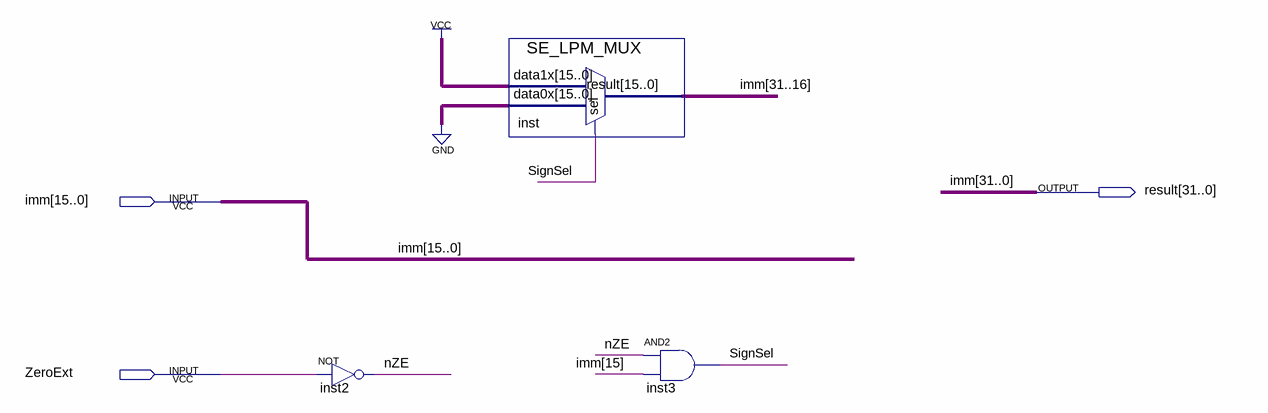
[diagram p0: schematic sheet]
// Quartus schematic SignExtender.bdf as structural Verilog: 3 symbols, 3 pins
module SignExtender (
  input  [15:0] imm,
  input  ZeroExt,
  output [31:0] result
);

  wire nZE, SignSel;

  not inst2 (nZE, ZeroExt);
  SE_LPM_MUX inst (.data1x({16{1'b1}}), .data0x({16{1'b0}}), .sel(SignSel), .result(result[31:16]));
  and inst3 (SignSel, nZE, imm[15]);

  assign result[15:0] = imm;

  // Other names for the same wires on the sheet: imm[31:16] = result[31:16]
endmodule
